# Altium schematic sheet U_ADCS_IMU.SchDoc
size A4; SheetNumber: 8; SheetTotal: 9
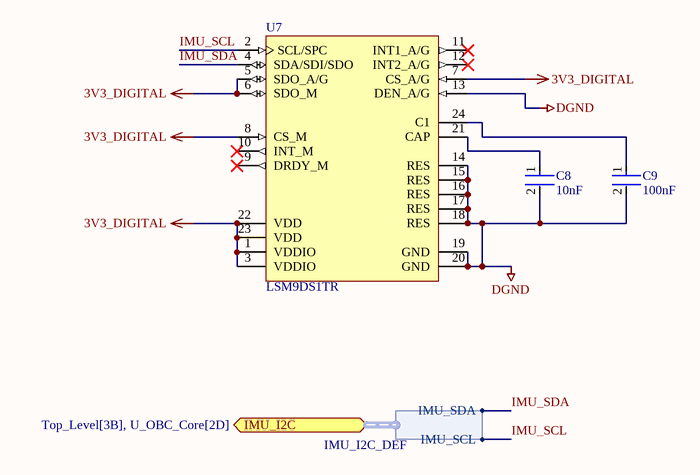
[diagram p0: U_ADCS_IMU.SchDoc]

## Parts
C8  10nF  [FP-GRM155-0_05-MFG]
C9  100nF  [FP-GRM21B-0_1-MFG]
U7  LSM9DS1TR  [STM-LGA-24_3500X3000X1000]

## Ports
IMU_I2C (bidir, harness IMU_I2C_DEF, see Top_Level[3B], U_OBC_Core[2D])

## Harnesses
IMU_I2C_DEF: IMU_SDA, IMU_SCL

## Nets
3V3_DIGITAL: U7.1(VDDIO) U7.3(VDDIO) U7.5(SDO_A/G) U7.6(SDO_M) U7.7(CS_A/G) U7.8(CS_M) U7.22(VDD) U7.23(VDD)
DGND: C8.2 C9.2 U7.13(DEN_A/G) U7.14(RES) U7.15(RES) U7.16(RES) U7.17(RES) U7.18(RES) U7.19(GND) U7.20(GND)
IMU_SCL: U7.2(SCL/SPC) ; port IMU_I2C.IMU_SCL
IMU_SDA: U7.4(SDA/SDI/SDO) ; port IMU_I2C.IMU_SDA
NetC8_1: C8.1 U7.21(CAP)
NetC9_1: C9.1 U7.24(C1)

Not connected (* = marked no-connect by the designer): U7 9(DRDY_M)* 10(INT_M)* 11(INT1_A/G)* 12(INT2_A/G)*

## Library data of the parts
C8 = CMP-06035-007234-1: Chip Multilayer Ceramic Capacitors for General Purpose, 0402, 10000pF, X7R, 15%, 5%, 50V; Packaging: Tape and Reel; Tolerance: 5%; Voltage Rating (DC): 50V; Dielectric: X7R; Package Quantity: 50000; Weight: 0.000212oz; Thickness: 500um; Capacitance: 10nF; Length: 1mm; Width: 500um
C9 = CMP-06035-043106-1: Chip Multilayer Ceramic Capacitors for General Purpose, 0805, 0.10uF, U2J, -750ppm/°C, 5%, 10V; Dielectric: U2J; Voltage Rating (DC): 10V; Thickness: 1.25mm; Width: 1.25mm; Length: 2mm; Case/Package: 0805; Capacitance: 100nF; Tolerance: 5%
U7 = CMP-2000-06606-1: iNEMO Inertial Module: 3D Accelerometer, 3D Gyroscope, 3D Magnetometer, 1.9 to 3.6 V, -40 to 85 degC, 24-Pin LGA, RoHS, Tape and Reel; Manufacturer: STMicroelectronics; SVHC: NoSVHC(17-Dec-2015); MEMS Module Function: Tri-AxisGyroscope,Tri-AxisAccelerometer,Tri-AxisMagnetometer; Supply Voltage Max: 3.6V; No. of Pins: 24Pins; Gyroscope Range: ±245°/s,±500°/s,±2000°/s; Acceleration Range: ±2g,±4g,±8g,±16g; Supply Voltage Min: 1.9V; Package Description: 24-Pin Plastic Land Grid Array Package, Body 3.65 x 3.15 mm, Pitch 0.43 mm; Manufacturer URL: http://www.st.com/; PartNumber: LSM9DS1; Product Range: -; Packaging: CutTape; Sensor Case Style: LGA; Datasheet URL: http://www2.st.com/content/ccc/resource/technical/document/datasheet/1e/3f/2a/d6/25/eb/48/46/DM00103319.pdf/files/DM00103319.pdf/jcr:content/translations/en.DM00103319.pdf; Package Reference: LGA-24_3500X3000X1000; Mounting Technology: SurfaceMount; Datasheet Version: Rev. 3, 03/2015; MSL: MSL3-168hours